# Altium schematic sheet CameraOrDisplay_Sheet.SchDoc
size A4; DocumentNumber: 11; SheetNumber: 11; SheetTotal: 27
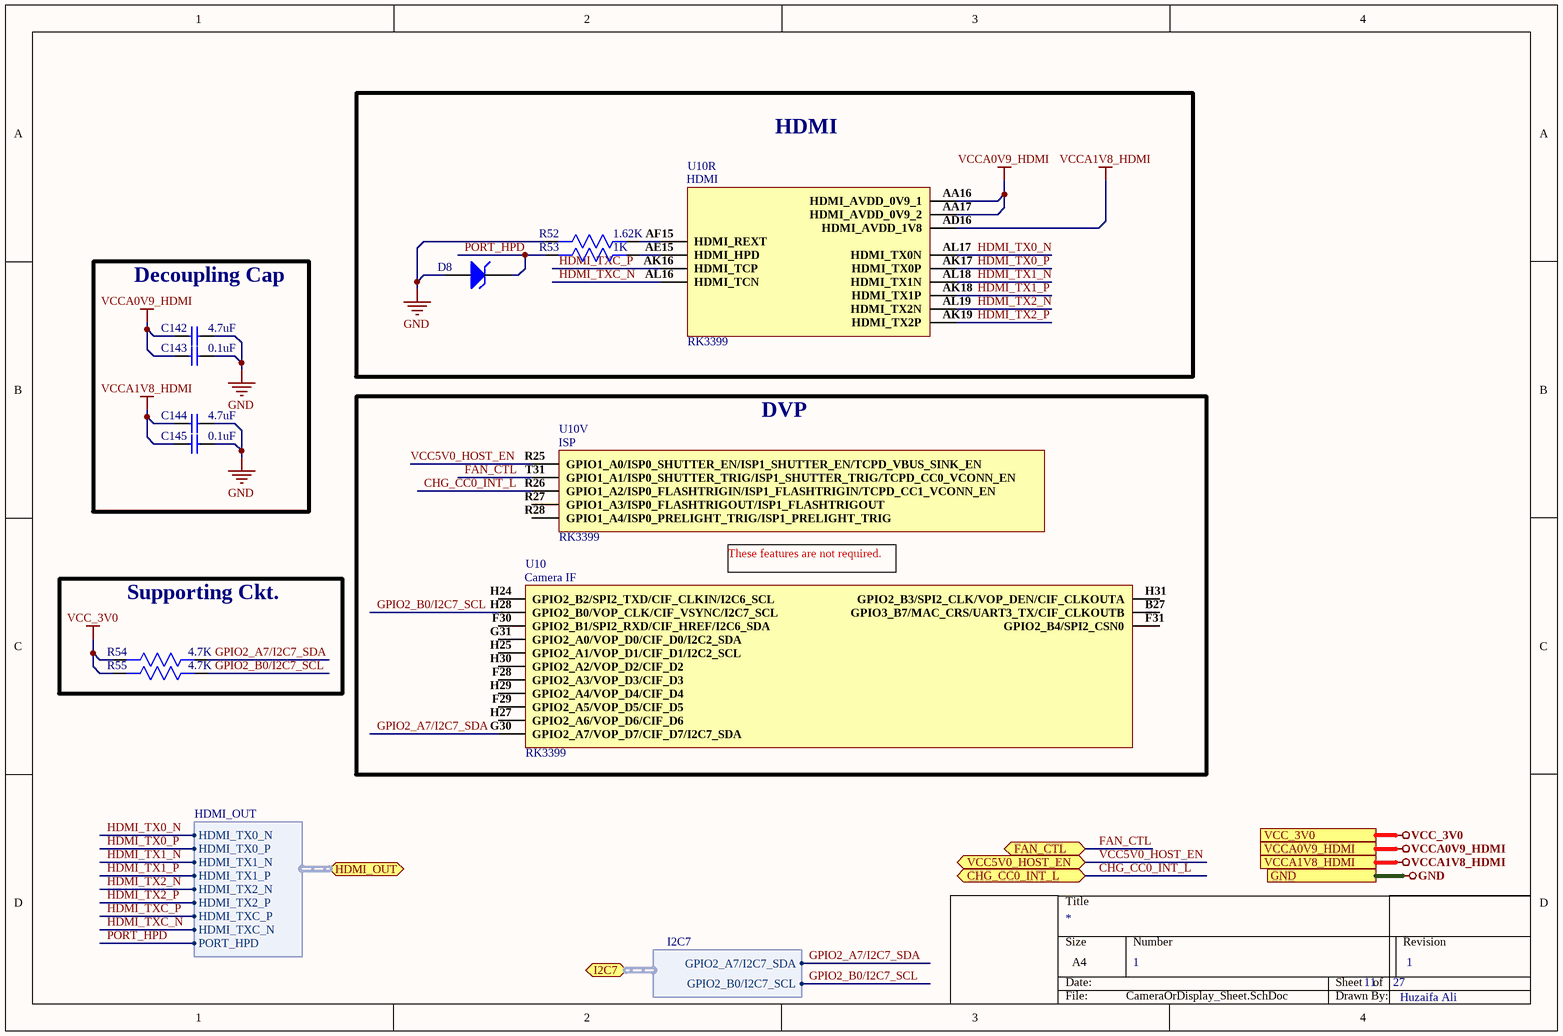
[diagram p0: CameraOrDisplay_Sheet.SchDoc]

## Parts
C142  4.7uF  [Cap0603]
C143  0.1uF  [Cap0402]
C144  4.7uF  [Cap0603]
C145  0.1uF  [Cap0402]
D8  BZT52C3V3-E3-08  [SOD-123]  (value not drawn)
R52  1.62K  [Res0603]
R53  1K  [Res0603]
R54  4.7K  [Res0603]
R55  4.7K  [Res0603]
U10  RK3399  [RK3399]  (parts R,V,28 of 34)

## Blocks framed on the sheet
HDMI: D8 R52 R53 U10
Decoupling Cap: C142-C145
DVP: U10
Supporting Ckt.: R54 R55

## Ports
CHG_CC0_INT_L (bidir), FAN_CTL (bidir), GND, HDMI_OUT (bidir, harness HDMI_OUT), I2C7 (bidir, harness I2C7), VCC5V0_HOST_EN (bidir), VCC_3V0, VCCA0V9_HDMI, VCCA1V8_HDMI

## Harnesses
HDMI_OUT: HDMI_TX0_N, HDMI_TX0_P, HDMI_TXC_P, HDMI_TXC_N, HDMI_TX1_N, HDMI_TX1_P, HDMI_TX2_N, HDMI_TX2_P, PORT_HPD
I2C7: GPIO2_B0/I2C7_SCL, GPIO2_A7/I2C7_SDA

## Nets
GND: C142.2 C143.2 C144.2 C145.2 D8.1(A) R52.2 ; port GND
VCC_3V0: R54.2 R55.2 ; port VCC_3V0
VCCA0V9_HDMI: C142.1 C143.1 U10.AA16(HDMI_AVDD_0V9_1) U10.AA17(HDMI_AVDD_0V9_2) ; port VCCA0V9_HDMI
VCCA1V8_HDMI: C144.1 C145.1 U10.AD16(HDMI_AVDD_1V8) ; port VCCA1V8_HDMI
CHG_CC0_INT_L: U10.R26(GPIO1_A2/ISP0_FLASHTRIGIN/ISP1_FLASHTRIGIN/TCPD_CC1_VCONN_EN) ; port CHG_CC0_INT_L
FAN_CTL: U10.T31(GPIO1_A1/ISP0_SHUTTER_TRIG/ISP1_SHUTTER_TRIG/TCPD_CC0_VCONN_EN) ; port FAN_CTL
GPIO2_A7/I2C7_SDA: R54.1 U10.G30(GPIO2_A7/VOP_D7/CIF_D7/I2C7_SDA) ; port I2C7.GPIO2_A7/I2C7_SDA
GPIO2_B0/I2C7_SCL: R55.1 U10.H28(GPIO2_B0/VOP_CLK/CIF_VSYNC/I2C7_SCL) ; port I2C7.GPIO2_B0/I2C7_SCL
HDMI_TX0_N: U10.AL17(HDMI_TX0N) ; port HDMI_OUT.HDMI_TX0_N
HDMI_TX0_P: U10.AK17(HDMI_TX0P) ; port HDMI_OUT.HDMI_TX0_P
HDMI_TX1_N: U10.AL18(HDMI_TX1N) ; port HDMI_OUT.HDMI_TX1_N
HDMI_TX1_P: U10.AK18(HDMI_TX1P) ; port HDMI_OUT.HDMI_TX1_P
HDMI_TX2_N: U10.AL19(HDMI_TX2N) ; port HDMI_OUT.HDMI_TX2_N
HDMI_TX2_P: U10.AK19(HDMI_TX2P) ; port HDMI_OUT.HDMI_TX2_P
HDMI_TXC_N: U10.AL16(HDMI_TCN) ; port HDMI_OUT.HDMI_TXC_N
HDMI_TXC_P: U10.AK16(HDMI_TCP) ; port HDMI_OUT.HDMI_TXC_P
PORT_HPD: D8.2(K) R53.2 ; port HDMI_OUT.PORT_HPD
VCC5V0_HOST_EN: U10.R25(GPIO1_A0/ISP0_SHUTTER_EN/ISP1_SHUTTER_EN/TCPD_VBUS_SINK_EN) ; port VCC5V0_HOST_EN
NetR52_1: R52.1 U10.AF15(HDMI_REXT)
NetR53_1: R53.1 U10.AE15(HDMI_HPD)

Not connected (* = marked no-connect by the designer): U10 B27(GPIO3_B7/MAC_CRS/UART3_TX/CIF_CLKOUTB) F28(GPIO2_A3/VOP_D3/CIF_D3) F29(GPIO2_A5/VOP_D5/CIF_D5) F30(GPIO2_B1/SPI2_RXD/CIF_HREF/I2C6_SDA) F31(GPIO2_B4/SPI2_CSN0) G31(GPIO2_A0/VOP_D0/CIF_D0/I2C2_SDA) H24(GPIO2_B2/SPI2_TXD/CIF_CLKIN/I2C6_SCL) H25(GPIO2_A1/VOP_D1/CIF_D1/I2C2_SCL) H27(GPIO2_A6/VOP_D6/CIF_D6) H29(GPIO2_A4/VOP_D4/CIF_D4) H30(GPIO2_A2/VOP_D2/CIF_D2) H31(GPIO2_B3/SPI2_CLK/VOP_DEN/CIF_CLKOUTA) R27(GPIO1_A3/ISP0_FLASHTRIGOUT/ISP1_FLASHTRIGOUT) R28(GPIO1_A4/ISP0_PRELIGHT_TRIG/ISP1_PRELIGHT_TRIG)

## Notes on the sheet
- (near U10) These features are not required.
- 1
- Huzaifa Ali
- (in symbol RK3399, part R) HDMI
- (in symbol RK3399, part V) ISP
- (in symbol RK3399, part 28) Camera IF

## Library data of the parts
C142 C144 = CL10A475KA8NQNC: CAP CER 4.7UF 25V X5R 0603; Manufacturer: Samsung; Tolerance: 10%; Supplier 1: Arrow Electronics; Manufacturer Part Number: CL10A475KA8NQNC; RoHS: Yes; Category: Ceramic Capacitors; Stock 1: 260000; Pricing 1: 4000=0.08490, 8000=0.05240, 16000=0.05180, 24000=0.05130, 40000=0.05070 (USD); Mount: Surface Mount; Case/Package: 0603; Case Code (Metric): 1608; Case Code (Imperial): 0603; Contact Plating: Tin; Min Operating Temperature: -55°C; Max Operating Temperature: 85°C; Package Quantity: 1; Packaging: Tape and Reel; Capacitance: 4.7uF; Voltage Rating: 25V; Dielectric: X5R; Series: CL; Termination: Wraparound; Construction: Flat; Length: 1.6mm; Width: 0.031inch; Thickness: 0.035inch; Depth: 0.8mm; Lead Free: Lead Free; RoHS Compliant: Yes; ComponentLink1URL: https://datasheet.ciiva.com/25787/cl10a475ka8nqnc-25787017.pdf?src-supplier=Digi-Key; ComponentLink1Description: https://datasheet.ciiva.com/25787/cl10a475ka8nqnc-25787017.pdf?src-supplier=Digi-Key; Supplier Part Number 1: CL10A475KA8NQNC
C143 C145 = CC0402KRX5R6BB104: CAP CER 0.1UF 10V X5R 0402; Manufacturer: Yageo; Capacitance: 100nF; Tolerance: 10%; Dissipation Factor: 5%; Insulation Resistance: 10GR; Supplier 1: Digi-Key; Manufacturer Part Number: CC0402KRX5R6BB104; RoHS: Yes; Category: Ceramic Capacitors; Stock 1: 6385580; Pricing 1: 1=0.10000, 10=0.02700, 50=0.01500, 100=0.01220, 500=0.00874, 1000=0.00687, 2500=0.00625, 5000=0.00575 (USD); Mount: Surface Mount; Case/Package: 0402; Number of Pins: 2; Case Code (Imperial): 0402; Case Code (Metric): 1005; Min Operating Temperature: -55°C; Max Operating Temperature: 85°C; Dielectric: X5R; Packaging: Tape and Reel; Voltage Rating: 10V; Package Quantity: 1; Termination: SMD/SMT; Voltage Rating (DC): 10V; Series: CC; Length: 1mm; Width: 0.02inch; Height: 0.5mm; Depth: 0.5mm; Thickness: 0.022inch; Radiation Hardening: No; RoHS Compliant: Yes; REACH SVHC: No SVHC; Lead Free: Lead Free; Halogen Free: Halogen Free; ComponentLink1URL: https://datasheet.ciiva.com/144/mlccorderingcode-144029.pdf?src-supplier=Digi-Key; ComponentLink1Description: https://datasheet.ciiva.com/144/mlccorderingcode-144029.pdf?src-supplier=Digi-Key; ComponentLink2URL: https://datasheet.ciiva.com/144/mlccorderingcode-144028.pdf?src-supplier=Digi-Key; ComponentLink2Description: https://datasheet.ciiva.com/144/mlccorderingcode-144028.pdf?src-supplier=Digi-Key; ComponentLink3URL: https://datasheet.ciiva.com/144/mlccorderingcode-144030.pdf?src-supplier=Digi-Key; ComponentLink3Description: https://datasheet.ciiva.com/144/mlccorderingcode-144030.pdf?src-supplier=Digi-Key; ComponentLink4URL: https://datasheet.ciiva.com/7978/1359354-7978091.pdf?src-supplier=Element14; ComponentLink4Description: https://datasheet.ciiva.com/7978/1359354-7978091.pdf?src-supplier=Element14; ComponentLink5URL: https://datasheet.ciiva.com/11587/upy-gphc-x5r-4v-to-50v-12-11587302.pdf?src-supplier=Avnet; ComponentLink5Description: https://datasheet.ciiva.com/11587/upy-gphc-x5r-4v-to-50v-12-11587302.pdf?src-supplier=Avnet; Supplier Part Number 1: 311-1336-1-ND
D8 = BZT52C3V3-E3-08: Diode Zener Single 3.3V 6% 500mW 2-Pin SOD-123; Manufacturer: Vishay; Max Power Dissipation: 410mW; Impedance: 80R; Voltage Tolerance: 5%; Zener Current: 109mA; Max Reverse Leakage Current: 100nA; Test Current: 5mA; ESD Protection: Yes; Supplier 1: Newark; Manufacturer Part Number: BZT52C3V3-E3-08; RoHS: Yes; Category: Zener Diodes; Pricing 1: 1=0.28100, 10=0.19500, 25=0.16300, 50=0.13100, 100=0.09800, 250=0.09200, 500=0.08500, 1000=0.05700 (USD); Mount: Surface Mount; Number of Pins: 2; Contact Plating: Tin,Matte; Min Operating Temperature: -55°C; Max Operating Temperature: 150°C; Zener Voltage: 3.3V; Element Configuration: Single; Power Dissipation: 500mW; Packaging: Tape and Reel; Package Quantity: 3000; Tolerance: 5%; Radiation Hardening: No; ComponentLink1URL: https://datasheet.ciiva.com/24094/bzt52-106265-24094953.pdf?src-supplier=Mouser; ComponentLink1Description: https://datasheet.ciiva.com/24094/bzt52-106265-24094953.pdf?src-supplier=Mouser; Supplier Part Number 1: 06AC5888
R52 = WR06X1621FTL: RES 1.62K OHM 1% 1/10W 0603; Manufacturer: Walsin Technologies; Power Rating: 100mW; Resistance: 1.62kR; Supplier 1: Arrow Electronics; Manufacturer Part Number: WR06X1621FTL; RoHS: Yes; Category: Chip SMD Resistors; Stock 1: 145000; Pricing 1: 5000=0.00100 (USD); Case/Package: Molded; Contact Material: Tin; Lead Free: Lead Free; RoHS Compliant: Yes; Supplier Part Number 1: WR06X1621FTL
R53 = RT0603DRD071KL: RES SMD 1K OHM 0.5% 1/10W 0603; Manufacturer: Yageo; Resistance: 1kR; Temperature Coefficient: 25ppm/°C; Power Rating: 100mW; Voltage Rating: 75V; Voltage Rating (DC): 50V; Supplier 1: Digi-Key; Manufacturer Part Number: RT0603DRD071KL; Stock 1: 178947; Pricing 1: 1=0.2, 10=0.167, 100=0.0651, 1000=0.02725, 2500=0.02498 (USD); Case/Package: 0603; Contact Plating: Tin,Matte; Case Code (Metric): 1608; Case Code (Imperial): 0603; Min Operating Temperature: -55°C; Max Operating Temperature: 125°C; Tolerance: 0.5%; Composition: Thin Film; Packaging: Tape and Reel; Termination: SMD/SMT; Radiation Hardening: No; Lead Free: Lead Free; ComponentLink1URL: http://www.mouser.com/ds/2/447/yageodocoutput-1125656.pdf?src-supplier=Mouser; ComponentLink1Description: http://www.mouser.com/ds/2/447/yageodocoutput-1125656.pdf?src-supplier=Mouser; ComponentLink2URL: http://www.yageo.com/documents/recent/PYu-RT_1-to-0.05_RoHS_L_6.pdf?src-supplier=Avnet; ComponentLink2Description: http://www.yageo.com/documents/recent/PYu-RT_1-to-0.05_RoHS_L_6.pdf?src-supplier=Avnet; Supplier Part Number 1: 311-1.0KDDKR-ND
R54 R55 = RC0603JR-074K7L: RES SMD 4.7K OHM 5% 1/10W 0603; Manufacturer: Yageo; Resistance: 4.7kR; Temperature Coefficient: 100ppm/°C; Voltage Rating (DC): 50V; Power Rating: 100mW; Supplier 1: Digi-Key; Manufacturer Part Number: RC0603JR-074K7L; Stock 1: 19706643; Pricing 1: 1=0.1, 10=0.02, 100=0.0081, 1000=0.00362, 2500=0.00314 (USD); Case/Package: 0603; Number of Pins: 2; Case Code (Imperial): 0603; Case Code (Metric): 1608; Min Operating Temperature: -55°C; Max Operating Temperature: 155°C; Tolerance: 5%; Composition: Thick Film; Packaging: Tape and Reel; Voltage Rating: 50V; Termination: SMD/SMT; Military Standard: Not; Length: 1.6mm; Width: 0.8mm; Depth: 0.8mm; REACH SVHC: No SVHC; Lead Free: Lead Free; ComponentLink1URL: http://www.farnell.com/datasheets/443971.pdf?src-supplier=Element14; ComponentLink1Description: http://www.farnell.com/datasheets/443971.pdf?src-supplier=Element14; Supplier Part Number 1: 311-4.7KGRCT-ND
U10 = RK3399: RK3399 CPU BGA for HD set-top box chip BGA Chipse; Manufacturer: Fuzhou Rockchip Electronics; ComponentLink1Description: Aliexpress; ComponentLink1URL: https://www.aliexpress.com/item/1005001971093459.html?spm=a2g0n.productlist.0.0.3c7csv8Qsv8Quh&browser_id=3ac7e9efb8074641aaabc4d871f09748&aff_trace_key=&aff_platform=msite&m_page_id=181389a08711fc2600d8cc522bab8d702dd4189be0&gclid=&pdp_npi=2%40dis%21USD%21%2123.6%21%21%21%21%21%402101d91e16545120399167831e8b89%21%21sea&algo_pvid=4303aedd-774c-4013-953d-920f10b55003; Manufacturer Part Number: RK3399; Footprint: FCBGA828